# Altium project Thunderscope_Rev5.3.PrjPcb (part 3 of 3)

## Sheet CON_PCIe_X4.SchDoc
size 297 x 209 mm
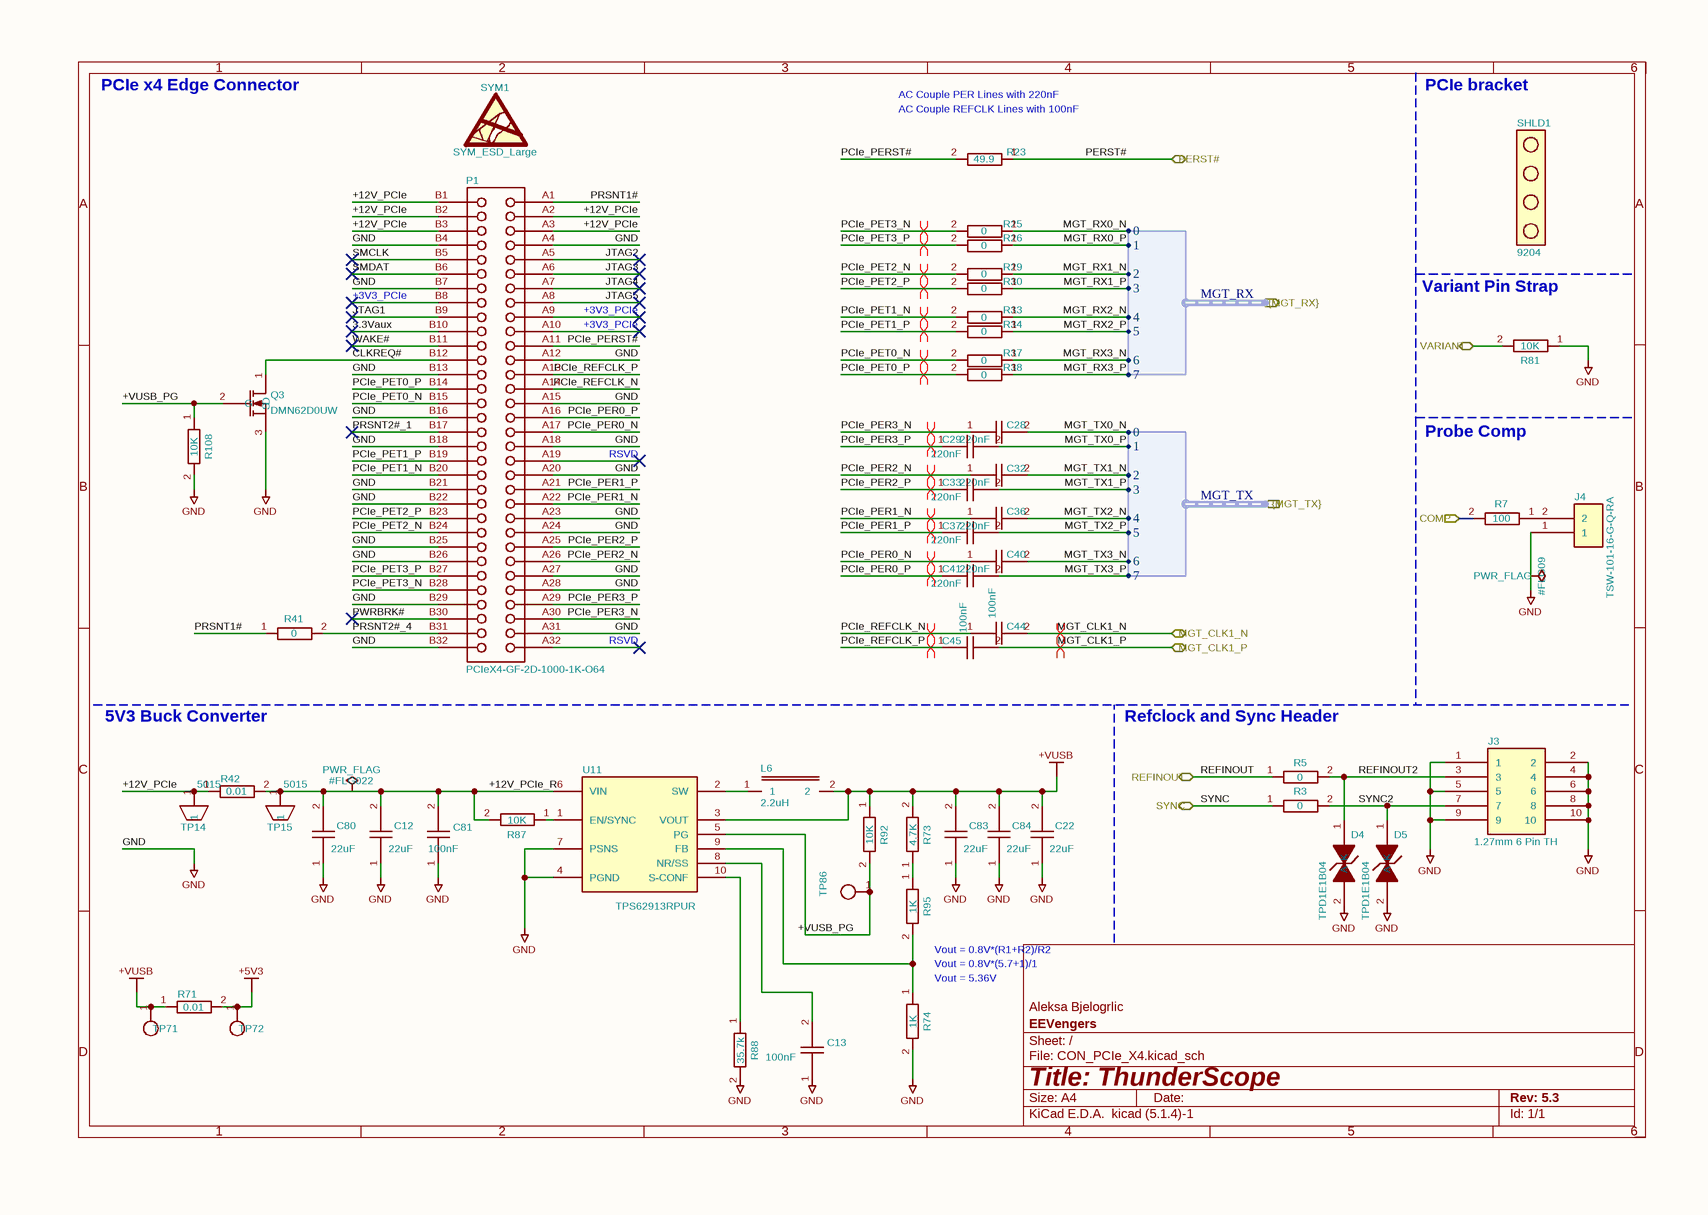
[diagram p11: CON_PCIe_X4.SchDoc]

### Parts
#FLG09  PWR_FLAG  (graphical)
#FLG022  PWR_FLAG  (graphical)
C12  22uF  [GEN_C_0805]
C13  100nF  [GEN_C_0402]
C22  22uF  [GEN_C_0805]
C28  220nF  [GEN_C_0402]
C29  220nF  [GEN_C_0402]
C32  220nF  [GEN_C_0402]
C33  220nF  [GEN_C_0402]
C36  220nF  [GEN_C_0402]
C37  220nF  [GEN_C_0402]
C40  220nF  [GEN_C_0402]
C41  220nF  [GEN_C_0402]
C44  100nF  [GEN_C_0402]
C45  100nF  [GEN_C_0402]
C80  22uF  [GEN_C_0805]
C81  100nF  [GEN_C_0402]
C83  22uF  [GEN_C_0805]
C84  22uF  [GEN_C_0805]
D4  TPD1E1B04  [TI_X1SON_DPY0002A]
D5  TPD1E1B04  [TI_X1SON_DPY0002A]
J3  1.27mm 6 Pin TH  [GEN_1.27mm_2x5_Pin_TH_RA]
J4  TSW-101-16-G-Q-RA  [GEN_5.08mm_1x2_Pin_TH_RA]
L6  2.2uH  [GEN_L_1210]
P1  PCIeX4-GF-2D-1000-1K-O64  [PCIeX4-GF-2D-1000-1K-O64]
Q3  DMN62D0UW  [GEN_SOT_323]
R3  0  [GEN_R_0402]
R5  0  [GEN_R_0402]
R7  100  [GEN_R_0402]
R23  49.9  [GEN_R_0402]
R25  0  [GEN_R_0402]
R26  0  [GEN_R_0402]
R29  0  [GEN_R_0402]
R30  0  [GEN_R_0402]
R33  0  [GEN_R_0402]
R34  0  [GEN_R_0402]
R37  0  [GEN_R_0402]
R38  0  [GEN_R_0402]
R41  0  [GEN_R_0402]
R42  0.01  [GEN_R_0603]
R71  0.01  [GEN_R_0603]
R73  4.7K  [GEN_R_0402]
R74  1K  [GEN_R_0402]
R81  10K  [GEN_R_0402]
R87  10K  [GEN_R_0402]
R88  35.7k  [GEN_R_0402]
R92  10K  [GEN_R_0402]
R95  1K  [GEN_R_0402]
R108  10K  [GEN_R_0402]
SHLD1  9204  (mechanical)
SYM1  SYM_ESD_Large  [ESD-Logo_6.6x6mm_SilkScreen]
TP14  5015  [KEY_5015]
TP15  5015  [KEY_5015]
TP71  PCB  [GEN_TP_PCB]  (value not drawn)
TP72  PCB  [GEN_TP_PCB]  (value not drawn)
TP86  PCB  [GEN_TP_PCB]  (value not drawn)
U11  value TPS62913RPUR  [TPS62913RPUR]  (hidden comment: TPS62913)

### Ports
COMP (in), MGT_CLK1_N (bidir), MGT_CLK1_P (bidir), PERST# (bidir), REFINOUT (bidir), SYNC (bidir), VARIANT (bidir), {MGT_RX} (out, harness MGT_RX), {MGT_TX} (in, harness MGT_TX)

### Harnesses
MGT_RX: 0, 1, 2, 3, 4, 5, 6, 7
MGT_TX: 0, 1, 2, 3, 4, 5, 6, 7

### Nets
+5V3: R71.2 TP72.1
+VUSB: C22.2 C83.2 C84.2 L6.2 R71.1 R73.2 R92.1 TP71.1 U11.3(VOUT)
GND: #FLG09.1 C12.1 C13.1 C22.1 C80.1 C81.1 C83.1 C84.1 D4.2(A) D5.2(A) J3.1 J3.2 J3.4 J3.5 J3.6 J3.8 J3.9 J3.10 J4.1 P1.A4 P1.A12 P1.A15 P1.A18 P1.A20 P1.A23 P1.A24 P1.A27 P1.A28 P1.A31 P1.B4 P1.B7 P1.B13 P1.B16 P1.B18 P1.B21 P1.B22 P1.B25 P1.B26 P1.B29 P1.B32 Q3.3(S) R74.2 R81.1 R88.2 R108.2 U11.4(PGND) U11.7(PSNS)
3.3Vaux: P1.B10
+12V_PCIe: P1.A2 P1.A3 P1.B1 P1.B2 P1.B3 R42.1 TP14.1
+12V_PCIe_R: #FLG022.1 C12.2 C80.2 C81.2 R42.2 R87.2 TP15.1 U11.6(VIN)
+VUSB_PG: Q3.2(G) R92.2 R108.1 TP86.1 U11.5(PG)
CLKREQ#: P1.B12 Q3.1(D)
COMP: R7.2 ; port COMP
JTAG1: P1.B9
JTAG2: P1.A5
JTAG3: P1.A6
JTAG4: P1.A7
JTAG5: P1.A8
MGT_CLK1_N: C44.2 ; port MGT_CLK1_N
MGT_CLK1_P: C45.2 ; port MGT_CLK1_P
MGT_RX0_N: R25.1 ; port {MGT_RX}.0
MGT_RX0_P: R26.1 ; port {MGT_RX}.1
MGT_RX1_N: R29.1 ; port {MGT_RX}.2
MGT_RX1_P: R30.1 ; port {MGT_RX}.3
MGT_RX2_N: R33.1 ; port {MGT_RX}.4
MGT_RX2_P: R34.1 ; port {MGT_RX}.5
MGT_RX3_N: R37.1 ; port {MGT_RX}.6
MGT_RX3_P: R38.1 ; port {MGT_RX}.7
MGT_TX0_N: C28.2 ; port {MGT_TX}.0
MGT_TX0_P: C29.2 ; port {MGT_TX}.1
MGT_TX1_N: C32.2 ; port {MGT_TX}.2
MGT_TX1_P: C33.2 ; port {MGT_TX}.3
MGT_TX2_N: C36.2 ; port {MGT_TX}.4
MGT_TX2_P: C37.2 ; port {MGT_TX}.5
MGT_TX3_N: C40.2 ; port {MGT_TX}.6
MGT_TX3_P: C41.2 ; port {MGT_TX}.7
PCIe_PER0_N: C40.1 P1.A17
PCIe_PER0_P: C41.1 P1.A16
PCIe_PER1_N: C36.1 P1.A22
PCIe_PER1_P: C37.1 P1.A21
PCIe_PER2_N: C32.1 P1.A26
PCIe_PER2_P: C33.1 P1.A25
PCIe_PER3_N: C28.1 P1.A30
PCIe_PER3_P: C29.1 P1.A29
PCIe_PERST#: P1.A11 R23.2
PCIe_PET0_N: P1.B15 R37.2
PCIe_PET0_P: P1.B14 R38.2
PCIe_PET1_N: P1.B20 R33.2
PCIe_PET1_P: P1.B19 R34.2
PCIe_PET2_N: P1.B24 R29.2
PCIe_PET2_P: P1.B23 R30.2
PCIe_PET3_N: P1.B28 R25.2
PCIe_PET3_P: P1.B27 R26.2
PCIe_REFCLK_N: C44.1 P1.A14
PCIe_REFCLK_P: C45.1 P1.A13
PERST#: R23.1 ; port PERST#
PRSNT1#: P1.A1 R41.1
PRSNT2#_1: P1.B17
PRSNT2#_4: P1.B31 R41.2
PWRBRK#: P1.B30
REFINOUT: R5.1 ; port REFINOUT
REFINOUT2: D4.1(K) J3.3 R5.2
SMCLK: P1.B5
SMDAT: P1.B6
SYNC: R3.1 ; port SYNC
SYNC2: D5.1(K) J3.7 R3.2
VARIANT: R81.2 ; port VARIANT
WAKE#: P1.B11
NetC13_2: C13.2 U11.8(NR/SS)
NetJ4_2: J4.2 R7.1
NetL6_1: L6.1 U11.2(SW)
NetR73_1: R73.1 R95.1
NetR74_1: R74.1 R95.2 U11.9(FB)
NetR87_1: R87.1 U11.1(EN/SYNC)
NetR88_1: R88.1 U11.10(S-CONF)

Not connected (* = marked no-connect by the designer): P1 A9* A10* A19* A32* B8*

### Layout directives
differential pair; differential pair class PCIe: PCIe_PER0_N, PCIe_PER0_P, PCIe_PER1_N, PCIe_PER1_P, PCIe_PER2_N, PCIe_PER2_P, PCIe_PER3_N, PCIe_PER3_P, PCIe_PET0_N, PCIe_PET0_P, PCIe_PET1_N, PCIe_PET1_P, PCIe_PET2_N, PCIe_PET2_P, PCIe_PET3_N, PCIe_PET3_P, PCIe_REFCLK_N, PCIe_REFCLK_P
differential pair: MGT_CLK1_N, MGT_CLK1_P

### Notes on the sheet
- PCIe x4 Edge Connector
- AC Couple PER Lines with 220nF
- (near R23) AC Couple REFCLK Lines with 100nF
- PCIe bracket
- +3V3_PCIe
- (near R81) Variant Pin Strap
- RSVD
- Probe Comp
- 5V3 Buck Converter
- Refclock and Sync Header
- Vout = 0.8V*(5.7+1)/1
- (near R95) Vout = 0.8V*(R1+R2)/R2
- (near R74) Vout = 5.36V
- 1
- 2
- 3
- 4
- 5
- 6
- A
- B
- C
- Aleksa Bjelogrlic
- D
- Title: ThunderScope
- File: CON_PCIe_X4.kicad_sch
- Sheet: /
- EEVengers
- KiCad E.D.A.  kicad (5.1.4)-1
- Size: A4
- Date:
- Rev: 5.3
- Id: 1/1

### Library data of the parts
C12 C22 C80 C83 C84 = CAP 22uF 25V X5R 0805: HOUSE PART NUMBER: C-22uF-0805-002; MANUFACTURER: Murata; MANUFACTURER PART NUMBER: GRM21BR61E226ME44L; VOLTAGE RATING: 25V; Substitutions Policy: Any Parametric Equivalent; PACKAGE: 0805; SUPPLIER 1: Mouser; SUPPLIER PART NUMBER 1: 81-GRM21BR61E226ME4L; Footprint: Thunderscope_Rev5:GEN_C_0805; Value: 22uF
C13 C44 C45 C81 = CAP 100nF 16V X7R 0402: HOUSE PART NUMBER: C-100nF-0402-002; MANUFACTURER: Murata; MANUFACTURER PART NUMBER: GCM155R71C104KA55D; VOLTAGE RATING: 16V; Substitutions Policy: Any Parametric Equivalent; PACKAGE: 0402; SUPPLIER 1: Mouser; SUPPLIER PART NUMBER 1: 81-GCM155R71C104KA5D; Footprint: Thunderscope_Rev5:GEN_C_0402; Value: 100nF
C28 C29 C32 C33 C36 C37 C40 C41 = CAP 220nF 16V X7R 0402: HOUSE PART NUMBER: C-100nF-0402-002; MANUFACTURER: Murata; MANUFACTURER PART NUMBER: GCM155R71C224KE02D; VOLTAGE RATING: 16V; Substitutions Policy: Any Parametric Equivalent; PACKAGE: 0402; SUPPLIER 1: Mouser; SUPPLIER PART NUMBER 1: 81-GCM155R71C224KE2D; Footprint: Thunderscope_Rev5:GEN_C_0402; Value: 220nF
D4 D5 = TVS TPD1E1B04: MANUFACTURER: Texas Instruments; MANUFACTURER PART NUMBER: TPD1E1B04DPYR; Substitutions Policy: No Substitutions; SUPPLIER 1: Texas Instruments; SUPPLIER PART NUMBER 1: TPD1E1B04DPYR; PACKAGE: 2-X1SON (1x0.6mm); Footprint: Thunderscope_Rev5:TI_X1SON_DPY0002A; Value: TPD1E1B04
J3 = CONN 1.27mm 2x5 Pin TH RA: MANUFACTURER: CNC Tech; MANUFACTURER PART NUMBER: 3220-10-0200-00; Substitutions Policy: ECO Required for Substitution; SUPPLIER 1: Digi-Key; SUPPLIER PART NUMBER 1: 1175-1628-ND; PACKAGE: Through Hole; Footprint: Thunderscope_Rev5:GEN_1.27mm_2x5_Pin_TH_RA; Value: 1.27mm 6 Pin TH
J4 = CONN 5.08mm 2 Pin TH RA: MANUFACTURER: Samtec; Substitutions Policy: ECO Required for Substitution; SUPPLIER 1: Mouser; SUPPLIER PART NUMBER 1: 200-TSW10116GQRA; MANUFACTURER PART NUMBER: TSW-101-16-G-Q-RA; PACKAGE: Through Hole; Value: TSW-101-16-G-Q-RA; Footprint: Thunderscope_Rev5:GEN_5.08mm_1x2_Pin_TH_RA
L6 = IND 1uH 5.5A 32 MOHM 1210: DFE322520FD-2R2M=P2; HOUSE PART NUMBER: SRP3212-1R0M; MANUFACTURER: Bourns; Substitutions Policy: ECO Required for Substitution; SUPPLIER 1: Mouser; SUPPLIER PART NUMBER 1: 652-SRP3212-1R0M; MANUFACTURER PART NUMBER: SRP3212-1R0M; PACKAGE: 1210; Value: 2.2uH; Footprint: Thunderscope_Rev5:GEN_L_1210
P1 = PCIeX4-GF-2D-1000-1K-O64: MATING CONNECTOR: Molex-87715-9106; DATASHEET VERSION: rev2.0, Apr-2007; PACKAGE REFERENCE: PCIeX4-GF-2D-1000-1K-O64; CLASSNAME: Edge Connector; PUBLISHER: Altium; COMPONENT KIND: Standard (No BOM); Footprint: Thunderscope_Rev5:PCIeX4-GF-2D-1000-1K-O64; Value: PCIeX4-GF-2D-1000-1K-O64
Q3 = NMOS DMN62D0UW: HOUSE PART NUMBER: DMN62D0UW-7; MANUFACTURER: Diodes; VDSS: 60V; Substitutions Policy: ECO Required for Substitution; SUPPLIER 1: Mouser; SUPPLIER PART NUMBER 1: 621-DMN62D0UW-7; MANUFACTURER PART NUMBER: DMN62D0UW-7; PACKAGE: SOT-323; Value: DMN62D0UW; Footprint: Thunderscope_Rev5:GEN_SOT_323
R3 R5 R25 R26 R29 R30 R33 R34 R37 R38 R41 = RES 0 OHM 1/16W 0402: MANUFACTURER: Yageo; MANUFACTURER PART NUMBER: RC0402JR-070RL; Substitutions Policy: Any Parametric Equivalent; PACKAGE: 0402; SUPPLIER 1: Mouser; SUPPLIER PART NUMBER 1: 603-RC0402JR-070RL; Footprint: Thunderscope_Rev5:GEN_R_0402; Value: 0
R7 = RES 100 OHM 1% 1/10W 0402: MANUFACTURER: Yageo; MANUFACTURER PART NUMBER: RC0402FR-07100RL; TOLERANCE: 1%; Substitutions Policy: Any Parametric Equivalent; PACKAGE: 0402; SUPPLIER 1: Mouser; SUPPLIER PART NUMBER 1: 603-RC0402FR-07100RL; Footprint: Thunderscope_Rev5:GEN_R_0402; Value: 100
R23 = RES 49.9 OHM 1% 1/10W 0402: MANUFACTURER: Yageo; MANUFACTURER PART NUMBER: RC0402FR-0749R9L; TOLERANCE: 1%; Substitutions Policy: Any Parametric Equivalent; PACKAGE: 0402; SUPPLIER 1: Mouser; SUPPLIER PART NUMBER 1: 603-RC0402FR-0749R9L; Footprint: Thunderscope_Rev5:GEN_R_0402; Value: 49.9
R42 R71 = RES 0.01 OHM 1% 1/4W 0603: HOUSE PART NUMBER: R-0.01-0603-1%-001; MANUFACTURER: Susumu; MANUFACTURER PART NUMBER: RL0816T-R010-F; TOLERANCE: 1%; Substitutions Policy: Any Parametric Equivalent; SUPPLIER 1: Mouser; SUPPLIER PART NUMBER 1: 754-RL0816T-R010-F; PACKAGE: 0603; Footprint: Thunderscope_Rev5:GEN_R_0603; Value: 0.01
R73 = RES 4.7K OHM 1% 1/16W 0402: MANUFACTURER: Yageo; MANUFACTURER PART NUMBER: RC0402FR-074K7L; TOLERANCE: 1%; Substitutions Policy: Any Parametric Equivalent; PACKAGE: 0402; SUPPLIER 1: Mouser; SUPPLIER PART NUMBER 1: 603-RC0402FR-074K7L; Footprint: Thunderscope_Rev5:GEN_R_0402; Value: 4.7K
R74 R95 = RES 1K OHM 1% 1/10W 0402: HOUSE PART NUMBER: R-1K-0402-1%-001; MANUFACTURER: Yageo; MANUFACTURER PART NUMBER: RC0402FR-071KL; TOLERANCE: 1%; Substitutions Policy: Any Parametric Equivalent; PACKAGE: 0402; SUPPLIER 1: Mouser; SUPPLIER PART NUMBER 1: 603-RC0402FR-071KL; Footprint: Thunderscope_Rev5:GEN_R_0402; Value: 1K
R81 R87 R92 R108 = RES 10K OHM 1% 1/16W 0402: MANUFACTURER: Yageo; MANUFACTURER PART NUMBER: RC0402FR-0710KL; TOLERANCE: 1%; Substitutions Policy: Any Parametric Equivalent; PACKAGE: 0402; SUPPLIER 1: Mouser; SUPPLIER PART NUMBER 1: 603-RC0402FR-0710KL; Footprint: Thunderscope_Rev5:GEN_R_0402; Value: 10K
R88 = RES 35.7K OHM 1% 1/16W 0402: MANUFACTURER: Yageo; MANUFACTURER PART NUMBER: RC0402FR-0735K7L; TOLERANCE: 1%; Substitutions Policy: Any Parametric Equivalent; PACKAGE: 0402; SUPPLIER 1: Mouser; SUPPLIER PART NUMBER 1: 603-RC0402FR-0735K7L; Footprint: Thunderscope_Rev5:GEN_R_0402; Value: 35.7k
SHLD1 = PCIe IO Shield: MANUFACTURER: Keystone Electronics; SUPPLIER 1: Mouser; SUPPLIER PART NUMBER 1: 534-9204; MANUFACTURER PART NUMBER: 9204; Value: 9204
TP14 TP15 = TP KEYSTONE 5015: MANUFACTURER: Keystone Electronics; SUPPLIER 1: Mouser; SUPPLIER PART NUMBER 1: 534-5015; MANUFACTURER PART NUMBER: 5015; Footprint: Thunderscope_Rev5:KEY_5015; Value: 5015
TP71 TP72 TP86 = TP PCB 1mm: Footprint: Thunderscope_Rev5:GEN_TP_PCB; Value: PCB
U11 = IC BUCK MODULE TPS62913: MANUFACTURER: Texas Instruments; MANUFACTURER PART NUMBER: TPSM82913RDUR; Substitutions Policy: No Substitutions; SUPPLIER 1: Texas Instruments; SUPPLIER PART NUMBER 1: TPSM82913RDUR; PACKAGE: 28-B0QFN (4.5x5.5mm); Footprint: Thunderscope_Rev5:TI_B0QFN_RDU0028A
#FLG09 #FLG022 = PWR_FLAG: Value: PWR_FLAG
SYM1 = SYM_ESD_Large: Value: SYM_ESD_Large; Footprint: Symbol:ESD-Logo_6.6x6mm_SilkScreen

## Sheet ADC.SchDoc
size 297 x 209 mm
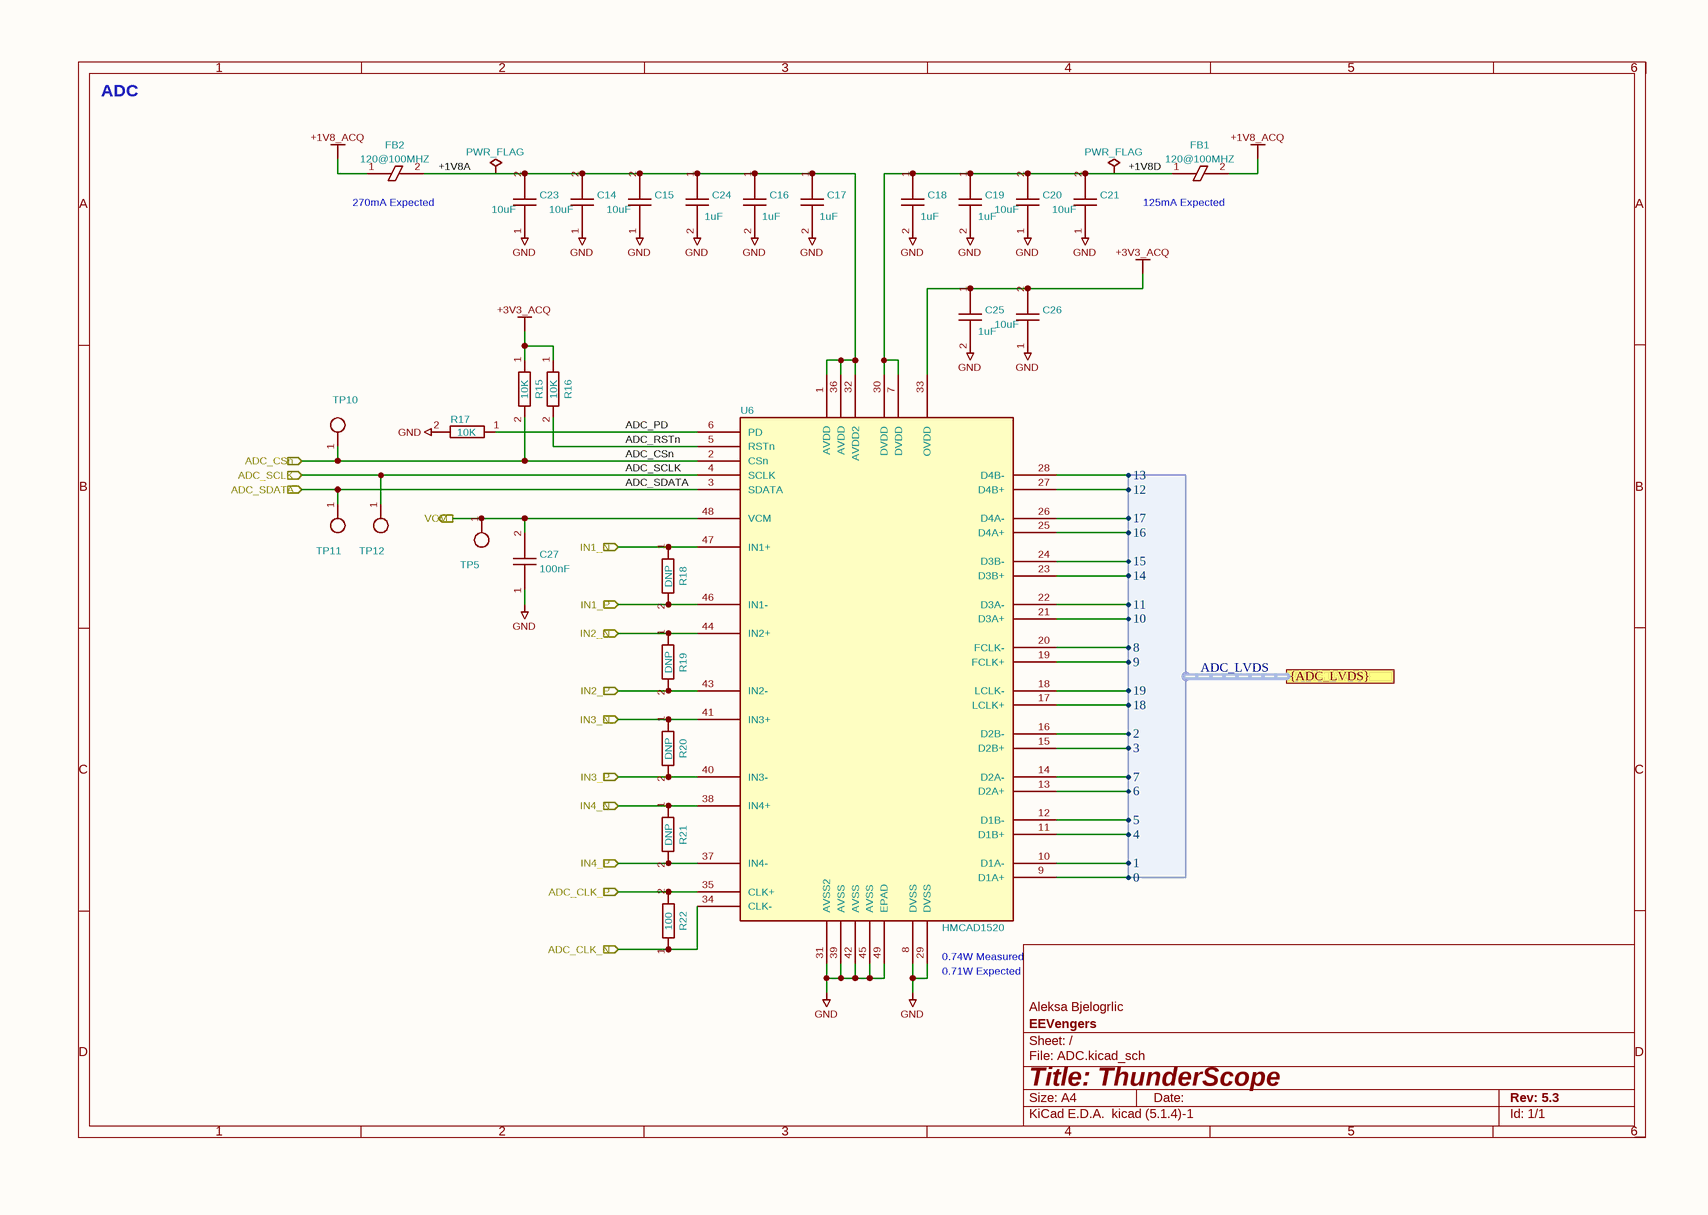
[diagram p12: ADC.SchDoc]

### Parts
#FLG07  PWR_FLAG  (graphical)
#FLG08  PWR_FLAG  (graphical)
C14  10uF  [GEN_C_0603]
C15  10uF  [GEN_C_0603]
C16  1uF  [GEN_C_0402]
C17  1uF  [GEN_C_0402]
C18  1uF  [GEN_C_0402]
C19  1uF  [GEN_C_0402]
C20  10uF  [GEN_C_0603]
C21  10uF  [GEN_C_0603]
C23  10uF  [GEN_C_0603]
C24  1uF  [GEN_C_0402]
C25  1uF  [GEN_C_0402]
C26  10uF  [GEN_C_0603]
C27  100nF  [GEN_C_0402]
FB1  120@100MHZ  [GEN_R_0402]
FB2  120@100MHZ  [GEN_R_0402]
R15  10K  [GEN_R_0402]
R16  10K  [GEN_R_0402]
R17  10K  [GEN_R_0402]
R18  DNP  [GEN_R_0402]
R19  DNP  [GEN_R_0402]
R20  DNP  [GEN_R_0402]
R21  DNP  [GEN_R_0402]
R22  100  [GEN_R_0402]
TP5  PCB  [GEN_TP_PCB]  (value not drawn)
TP10  PCB  [GEN_TP_PCB]  (value not drawn)
TP11  PCB  [GEN_TP_PCB]  (value not drawn)
TP12  PCB  [GEN_TP_PCB]  (value not drawn)
U6  HMCAD1520  [AD_QFN48_LP7]

### Ports
ADC_CLK_N (in), ADC_CLK_P (in), ADC_CSn (in), ADC_SCLK (in), ADC_SDATA (in), IN1_N (in), IN1_P (in), IN2_N (in), IN2_P (in), IN3_N (in), IN3_P (in), IN4_N (in), IN4_P (in), VCM (out), {ADC_LVDS} (harness ADC_LVDS)

### Harnesses
ADC_LVDS: 0, 1, 2, 3, 4, 5, 6, 7, 8, 9, 10, 11, 12, 13, 14, 15, 16, 17, 18, 19

### Nets
+1V8_ACQ: FB1.2 FB2.1
+3V3_ACQ: C25.1 C26.2 R15.1 R16.1 U6.33(OVDD)
GND: C14.1 C15.1 C16.2 C17.2 C18.2 C19.2 C20.1 C21.1 C23.1 C24.2 C25.2 C26.1 C27.1 R17.2 U6.8(DVSS) U6.29(DVSS) U6.31(AVSS2) U6.39(AVSS) U6.42(AVSS) U6.45(AVSS) U6.49(EPAD)
+1V8A: #FLG07.1 C14.2 C15.2 C16.1 C17.1 C23.2 C24.1 FB2.2 U6.1(AVDD) U6.32(AVDD2) U6.36(AVDD)
+1V8D: #FLG08.1 C18.1 C19.1 C20.2 C21.2 FB1.1 U6.7(DVDD) U6.30(DVDD)
ADC_CLK_N: R22.1 U6.34(CLK-) ; port ADC_CLK_N
ADC_CLK_P: R22.2 U6.35(CLK+) ; port ADC_CLK_P
ADC_CSn: R15.2 TP10.1 U6.2(CSn) ; port ADC_CSn
ADC_PD: R17.1 U6.6(PD)
ADC_RSTn: R16.2 U6.5(RSTn)
ADC_SCLK: TP12.1 U6.4(SCLK) ; port ADC_SCLK
ADC_SDATA: TP11.1 U6.3(SDATA) ; port ADC_SDATA
D1A_N: U6.10(D1A-) ; port {ADC_LVDS}.1
D1A_P: U6.9(D1A+) ; port {ADC_LVDS}.0
D1B_N: U6.12(D1B-) ; port {ADC_LVDS}.5
D1B_P: U6.11(D1B+) ; port {ADC_LVDS}.4
D2A_N: U6.14(D2A-) ; port {ADC_LVDS}.7
D2A_P: U6.13(D2A+) ; port {ADC_LVDS}.6
D2B_N: U6.16(D2B-) ; port {ADC_LVDS}.2
D2B_P: U6.15(D2B+) ; port {ADC_LVDS}.3
D3A_N: U6.22(D3A-) ; port {ADC_LVDS}.11
D3A_P: U6.21(D3A+) ; port {ADC_LVDS}.10
D3B_N: U6.24(D3B-) ; port {ADC_LVDS}.15
D3B_P: U6.23(D3B+) ; port {ADC_LVDS}.14
D4A_N: U6.26(D4A-) ; port {ADC_LVDS}.17
D4A_P: U6.25(D4A+) ; port {ADC_LVDS}.16
D4B_N: U6.28(D4B-) ; port {ADC_LVDS}.13
D4B_P: U6.27(D4B+) ; port {ADC_LVDS}.12
FCLK_N: U6.20(FCLK-) ; port {ADC_LVDS}.8
FCLK_P: U6.19(FCLK+) ; port {ADC_LVDS}.9
IN1_N: R18.1 U6.47(IN1+) ; port IN1_N
IN1_P: R18.2 U6.46(IN1-) ; port IN1_P
IN2_N: R19.1 U6.44(IN2+) ; port IN2_N
IN2_P: R19.2 U6.43(IN2-) ; port IN2_P
IN3_N: R20.1 U6.41(IN3+) ; port IN3_N
IN3_P: R20.2 U6.40(IN3-) ; port IN3_P
IN4_N: R21.1 U6.38(IN4+) ; port IN4_N
IN4_P: R21.2 U6.37(IN4-) ; port IN4_P
LCLK_N: U6.18(LCLK-) ; port {ADC_LVDS}.19
LCLK_P: U6.17(LCLK+) ; port {ADC_LVDS}.18
VCM: C27.2 TP5.1 U6.48(VCM) ; port VCM

### Notes on the sheet
- ADC
- (near FB2) 270mA Expected
- 125mA Expected
- (near U6) 0.74W Measured
- (near U6) 0.71W Expected
- 1
- 2
- 3
- 4
- 5
- 6
- A
- B
- C
- Aleksa Bjelogrlic
- D
- Title: ThunderScope
- File: ADC.kicad_sch
- Sheet: /
- EEVengers
- KiCad E.D.A.  kicad (5.1.4)-1
- Size: A4
- Date:
- Rev: 5.3
- Id: 1/1

### Library data of the parts
C14 C15 C20 C21 C23 C26 = CAP 10uF 25V X5R 0603: MANUFACTURER: Murata; MANUFACTURER PART NUMBER: GRM188R61E106MA73D; VOLTAGE RATING: 25V; Substitutions Policy: Any Parametric Equivalent; PACKAGE: 0402; SUPPLIER 1: Mouser; SUPPLIER PART NUMBER 1: 81-GRM188R61E106MA3D; Footprint: Thunderscope_Rev5:GEN_C_0603; Value: 10uF
C16-C19 C24 C25 = CAP 1uF 25V X5R 0402: MANUFACTURER: Murata; MANUFACTURER PART NUMBER: GRM155R61E105KA12D; VOLTAGE RATING: 25V; Substitutions Policy: Any Parametric Equivalent; PACKAGE: 0402; SUPPLIER 1: Mouser; SUPPLIER PART NUMBER 1: 81-GRM155R61E105KA2D; Footprint: Thunderscope_Rev5:GEN_C_0402; Value: 1uF
C27 = CAP 100nF 16V X7R 0402: as C13 on sheet CON_PCIe_X4; PACKAGE: 0402; SUPPLIER 1: Mouser; SUPPLIER PART NUMBER 1: 81-GCM155R71C104KA5D; Footprint: Thunderscope_Rev5:GEN_C_0402; Value: 100nF
FB1 FB2 = FERRITE BEAD 120 OHM 0402: HOUSE PART NUMBER: BLM15PX121SN1D; MANUFACTURER: Murata; Substitutions Policy: No Substitutions; SUPPLIER 1: Mouser; SUPPLIER PART NUMBER 1: 81-BLM15PX121SN1D; MANUFACTURER PART NUMBER: BLM15PX121SN1D; PACKAGE: 0402; Footprint: Thunderscope_Rev5:GEN_R_0402; Value: 120@100MHZ
R15-R17 = RES 10K OHM 1% 1/16W 0402: as R81 on sheet CON_PCIe_X4; PACKAGE: 0402; SUPPLIER 1: Mouser; SUPPLIER PART NUMBER 1: 603-RC0402FR-0710KL; Footprint: Thunderscope_Rev5:GEN_R_0402; Value: 10K
R18-R21 = RES DNP 0402: TOLERANCE: 1%; PACKAGE: 0402; Footprint: Thunderscope_Rev5:GEN_R_0402; Value: DNP
R22 = RES 100 OHM 1% 1/10W 0402: as R7 on sheet CON_PCIe_X4; PACKAGE: 0402; SUPPLIER 1: Mouser; SUPPLIER PART NUMBER 1: 603-RC0402FR-07100RL; Footprint: Thunderscope_Rev5:GEN_R_0402; Value: 100
TP5 TP10-TP12 = TP PCB 1mm: Footprint: Thunderscope_Rev5:GEN_TP_PCB; Value: PCB
U6 = IC ADC HMCAD1520: MANUFACTURER: Analog Devices; Substitutions Policy: No Substitutions; SUPPLIER 1: Mouser; SUPPLIER PART NUMBER 1: 584-HMCAD1520; MANUFACTURER PART NUMBER: HMCAD1520; PACKAGE: 48-QFN (7x7mm); Footprint: Thunderscope_Rev5:AD_QFN48_LP7; Value: HMCAD1520
#FLG07 #FLG08 = PWR_FLAG: Value: PWR_FLAG

## Sheet FE.SchDoc
size 297 x 209 mm
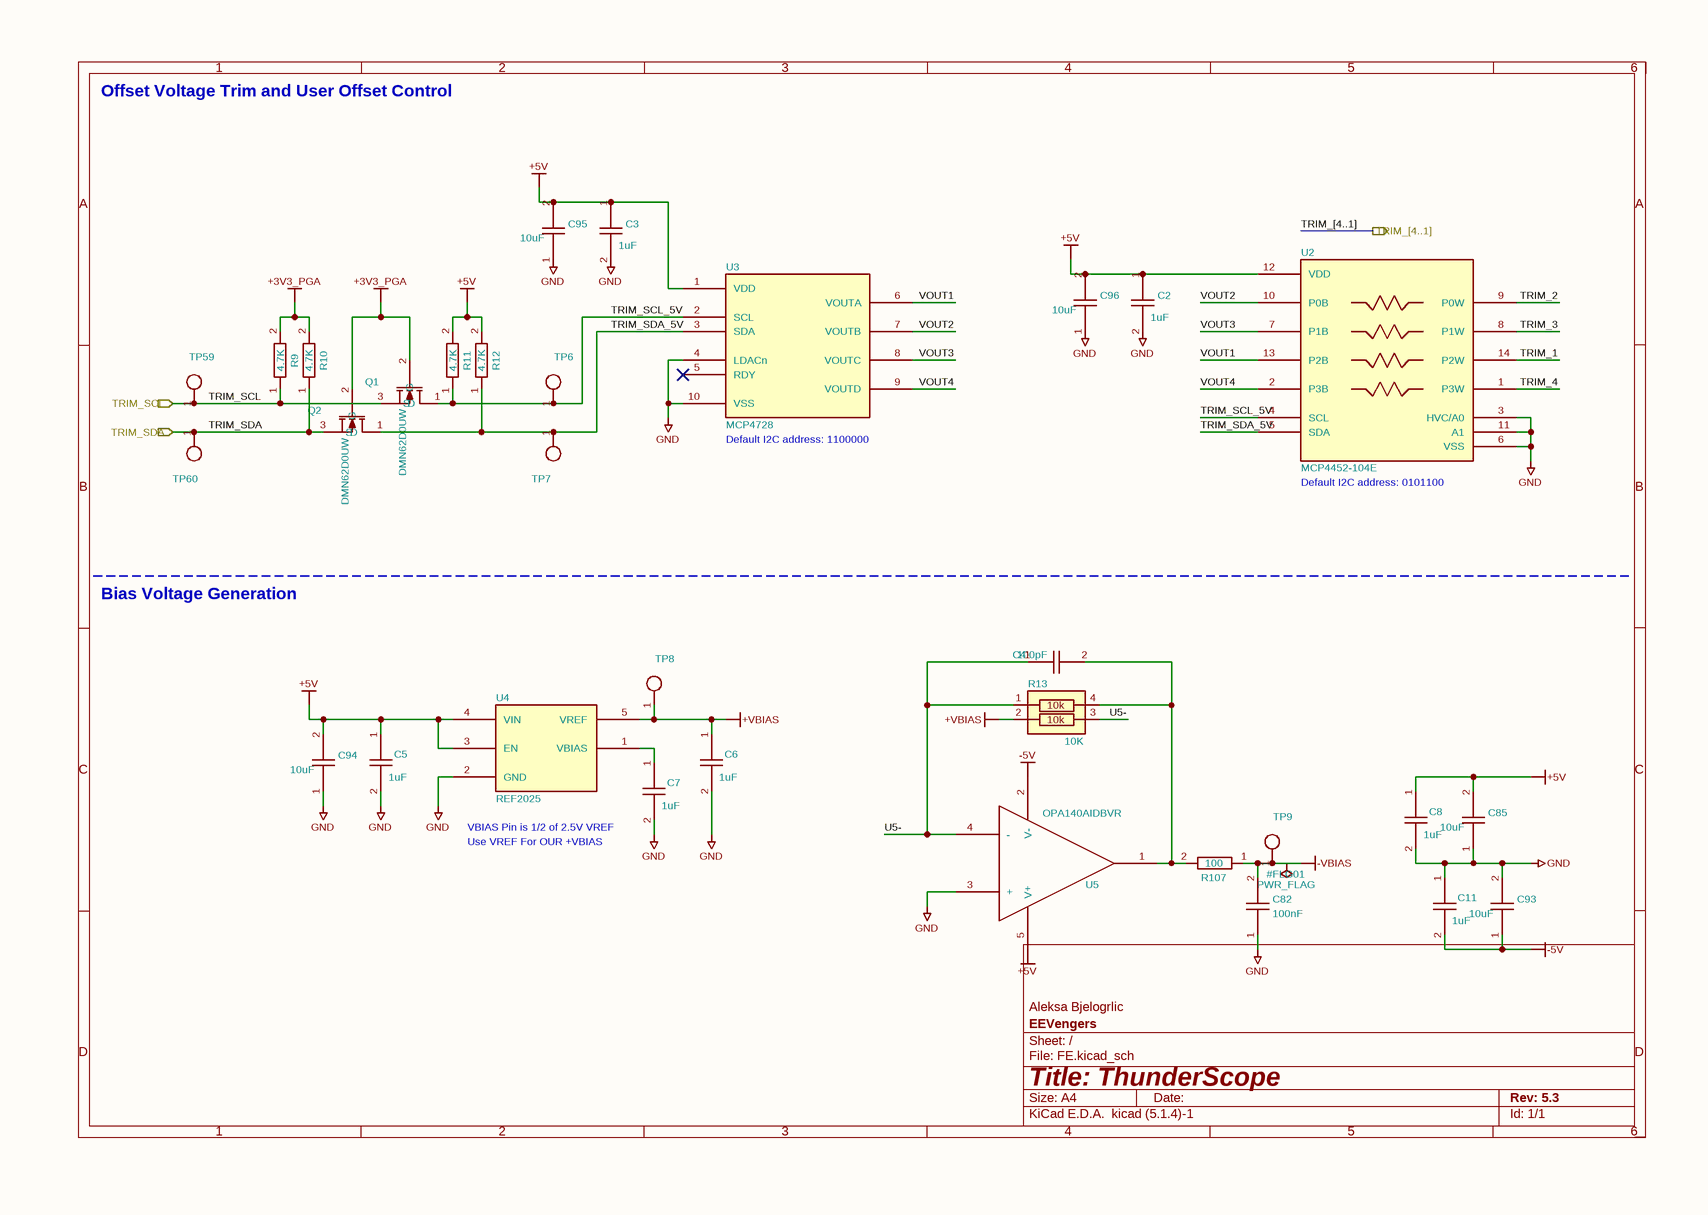
[diagram p13: FE.SchDoc]

### Parts
#FLG01  PWR_FLAG  (graphical)
C2  1uF  [GEN_C_0402]
C3  1uF  [GEN_C_0402]
C4  100pF  [GEN_C_0402]
C5  1uF  [GEN_C_0402]
C6  1uF  [GEN_C_0402]
C7  1uF  [GEN_C_0402]
C8  1uF  [GEN_C_0402]
C11  1uF  [GEN_C_0402]
C82  100nF  [GEN_C_0402]
C85  10uF  [GEN_C_0603]
C93  10uF  [GEN_C_0603]
C94  10uF  [GEN_C_0603]
C95  10uF  [GEN_C_0603]
C96  10uF  [GEN_C_0603]
Q1  DMN62D0UW  [GEN_SOT_323]
Q2  DMN62D0UW  [GEN_SOT_323]
R9  4.7K  [GEN_R_0402]
R10  4.7K  [GEN_R_0402]
R11  4.7K  [GEN_R_0402]
R12  4.7K  [GEN_R_0402]
R13  10K  [GEN_R_2ARRAY_0606]
R107  100  [GEN_R_0402]
TP6  PCB  [GEN_TP_PCB]  (value not drawn)
TP7  PCB  [GEN_TP_PCB]  (value not drawn)
TP8  PCB  [GEN_TP_PCB]  (value not drawn)
TP9  PCB  [GEN_TP_PCB]  (value not drawn)
TP59  PCB  [GEN_TP_PCB]  (value not drawn)
TP60  PCB  [GEN_TP_PCB]  (value not drawn)
U2  MCP4452-104E  [MC_TSSOP14]
U3  MCP4728  [MC_MSOP10_UN]
U4  REF2025  [GEN_SOT23_5_950_2900X1600X1450]
U5  OPA140AIDBVR  [GEN_SOT23_5_950_2900X1600X1450]

### Ports
TRIM_[4..1] (out), TRIM_SCL (in), TRIM_SDA (in)

### Nets
+3V3_PGA: Q1.2(G) Q2.2(G) R9.2 R10.2
+5V: C2.1 C3.1 C5.1 C8.1 C85.2 C94.2 C95.2 C96.2 R11.2 R12.2 U2.12(VDD) U3.1(VDD) U4.3(EN) U4.4(VIN) U5.5(V+)
+VBIAS: C6.1 R13.2 TP8.1 U4.5(VREF)
-5V: C11.2 C93.1 U5.2(V-)
-VBIAS: #FLG01.1 C82.2 R107.1 TP9.1
GND: C2.2 C3.2 C5.2 C6.2 C7.2 C8.2 C11.1 C82.1 C85.1 C93.2 C94.1 C95.1 C96.1 U2.3(HVC/A0) U2.6(VSS) U2.11(A1) U3.4(LDACn) U3.10(VSS) U4.2(GND) U5.3(+)
TRIM_1: U2.14(P2W)
TRIM_2: U2.9(P0W)
TRIM_3: U2.8(P1W)
TRIM_4: U2.1(P3W)
TRIM_SCL: Q1.3(S) R9.1 TP59.1 ; port TRIM_SCL
TRIM_SCL_5V: Q1.1(D) R11.1 TP6.1 U2.4(SCL) U3.2(SCL)
TRIM_SDA: Q2.3(S) R10.1 TP60.1 ; port TRIM_SDA
TRIM_SDA_5V: Q2.1(D) R12.1 TP7.1 U2.5(SDA) U3.3(SDA)
U5-: C4.1 R13.1 R13.3 U5.4(-)
VOUT1: U2.13(P2B) U3.6(VOUTA)
VOUT2: U2.10(P0B) U3.7(VOUTB)
VOUT3: U2.7(P1B) U3.8(VOUTC)
VOUT4: U2.2(P3B) U3.9(VOUTD)
NetC4_2: C4.2 R13.4 R107.2 U5.1(OUT)
NetC7_1: C7.1 U4.1(VBIAS)

Not connected (* = marked no-connect by the designer): U3 5(RDY)*

### Buses and harness runs
bus TRIM_[4..1] = port TRIM_[4..1]

### Notes on the sheet
- Offset Voltage Trim and User Offset Control
- (near U3) Default I2C address: 1100000
- (near U2) Default I2C address: 0101100
- Bias Voltage Generation
- Use VREF For OUR +VBIAS
- VBIAS Pin is 1/2 of 2.5V VREF
- 1
- 2
- 3
- 4
- 5
- 6
- A
- B
- C
- Aleksa Bjelogrlic
- D
- Title: ThunderScope
- File: FE.kicad_sch
- Sheet: /
- EEVengers
- KiCad E.D.A.  kicad (5.1.4)-1
- Size: A4
- Date:
- Rev: 5.3
- Id: 1/1
- (in symbol RES ARRAY 2x 10K OHM 0.05% 0606) 10k

### Library data of the parts
C2 C3 C5-C8 C11 = CAP 1uF 25V X5R 0402: as C16 on sheet ADC; PACKAGE: 0402; SUPPLIER 1: Mouser; SUPPLIER PART NUMBER 1: 81-GRM155R61E105KA2D; Footprint: Thunderscope_Rev5:GEN_C_0402; Value: 1uF
C4 = CAP 100pF 50V C0G 0402: MANUFACTURER: Murata; MANUFACTURER PART NUMBER: GCM1555C1H101FA16D; TEMPERATURE COEFFICIENT: C0G; VOLTAGE RATING: 50V; Substitutions Policy: Any Parametric Equivalent; PACKAGE: 0402; SUPPLIER 1: Mouser; SUPPLIER PART NUMBER 1: 81-GCM1555C1H101FA6D; Footprint: Thunderscope_Rev5:GEN_C_0402; Value: 100pF
C82 = CAP 100nF 16V X7R 0402: as C13 on sheet CON_PCIe_X4; PACKAGE: 0402; SUPPLIER 1: Mouser; SUPPLIER PART NUMBER 1: 81-GCM155R71C104KA5D; Footprint: Thunderscope_Rev5:GEN_C_0402; Value: 100nF
C85 C93-C96 = CAP 10uF 25V X5R 0603: as C14 on sheet ADC; PACKAGE: 0402; SUPPLIER 1: Mouser; SUPPLIER PART NUMBER 1: 81-GRM188R61E106MA3D; Footprint: Thunderscope_Rev5:GEN_C_0603; Value: 10uF
Q1 Q2 = NMOS DMN62D0UW: as Q3 on sheet CON_PCIe_X4; SUPPLIER 1: Mouser; SUPPLIER PART NUMBER 1: 621-DMN62D0UW-7; MANUFACTURER PART NUMBER: DMN62D0UW-7; PACKAGE: SOT-323; Value: DMN62D0UW; Footprint: Thunderscope_Rev5:GEN_SOT_323
R9-R12 = RES 4.7K OHM 1% 1/16W 0402: as R73 on sheet CON_PCIe_X4; PACKAGE: 0402; SUPPLIER 1: Mouser; SUPPLIER PART NUMBER 1: 603-RC0402FR-074K7L; Footprint: Thunderscope_Rev5:GEN_R_0402; Value: 4.7K
R13 = RES ARRAY 2x 10K OHM 0.05% 0606: MANUFACTURER: Vishay Beyschlag; MANUFACTURER PART NUMBER: ACASN1002S1002P1ATF1002X; TOLERANCE: 1%; Substitutions Policy: No Substitutions; PACKAGE: 0606; SUPPLIER 1: Mouser; SUPPLIER PART NUMBER 1: 594-ACASN1002S1002AT; Footprint: Thunderscope_Rev5:GEN_R_2ARRAY_0606; Value: 10K
R107 = RES 100 OHM 1% 1/10W 0402: as R7 on sheet CON_PCIe_X4; PACKAGE: 0402; SUPPLIER 1: Mouser; SUPPLIER PART NUMBER 1: 603-RC0402FR-07100RL; Footprint: Thunderscope_Rev5:GEN_R_0402; Value: 100
TP6-TP9 TP59 TP60 = TP PCB 1mm: Footprint: Thunderscope_Rev5:GEN_TP_PCB; Value: PCB
U2 = IC DIGIPOT QUAD MCP4452-104E: MANUFACTURER: Microchip; Substitutions Policy: ECO Required for Substitution; SUPPLIER 1: Mouser; SUPPLIER PART NUMBER 1: 579-MCP4452-104E/ST; MANUFACTURER PART NUMBER: MCP4452-104E; PACKAGE: 14-TSSOP; Value: MCP4452-104E; Footprint: Thunderscope_Rev5:MC_TSSOP14
U3 = IC DAC QUAD MCP4728: MANUFACTURER: Microchip; MANUFACTURER PART NUMBER: MCP4728T-E/UN; Substitutions Policy: ECO Required for Substitution; SUPPLIER 1: Mouser; SUPPLIER PART NUMBER 1: 579-MCP4728T-E/UN; PACKAGE: 10-MSOP; Value: MCP4728; Footprint: Thunderscope_Rev5:MC_MSOP10_UN
U4 = IC VREF REF2025: MANUFACTURER: Texas Instruments; MANUFACTURER PART NUMBER: REF2025AIDDCR; Substitutions Policy: No Substitutions; SUPPLIER 1: Texas Instruments; SUPPLIER PART NUMBER 1: REF2025AIDDCR; PACKAGE: SOT-23-5; Value: REF2025; Footprint: Thunderscope_Rev5:GEN_SOT23_5_950_2900X1600X1450
U5 = IC OPAMP OPA140: MANUFACTURER: Texas Instruments; Substitutions Policy: No Substitutions; SUPPLIER 1: Texas Instruments; SUPPLIER PART NUMBER 1: OPA140AIDBVR; MANUFACTURER PART NUMBER: OPA140AIDBVR; PACKAGE: SOT-23-5; Value: OPA140AIDBVR; Footprint: Thunderscope_Rev5:GEN_SOT23_5_950_2900X1600X1450
#FLG01 = PWR_FLAG: Value: PWR_FLAG

## Sheet ACQ_FE_VREG.SchDoc
size 297 x 209 mm
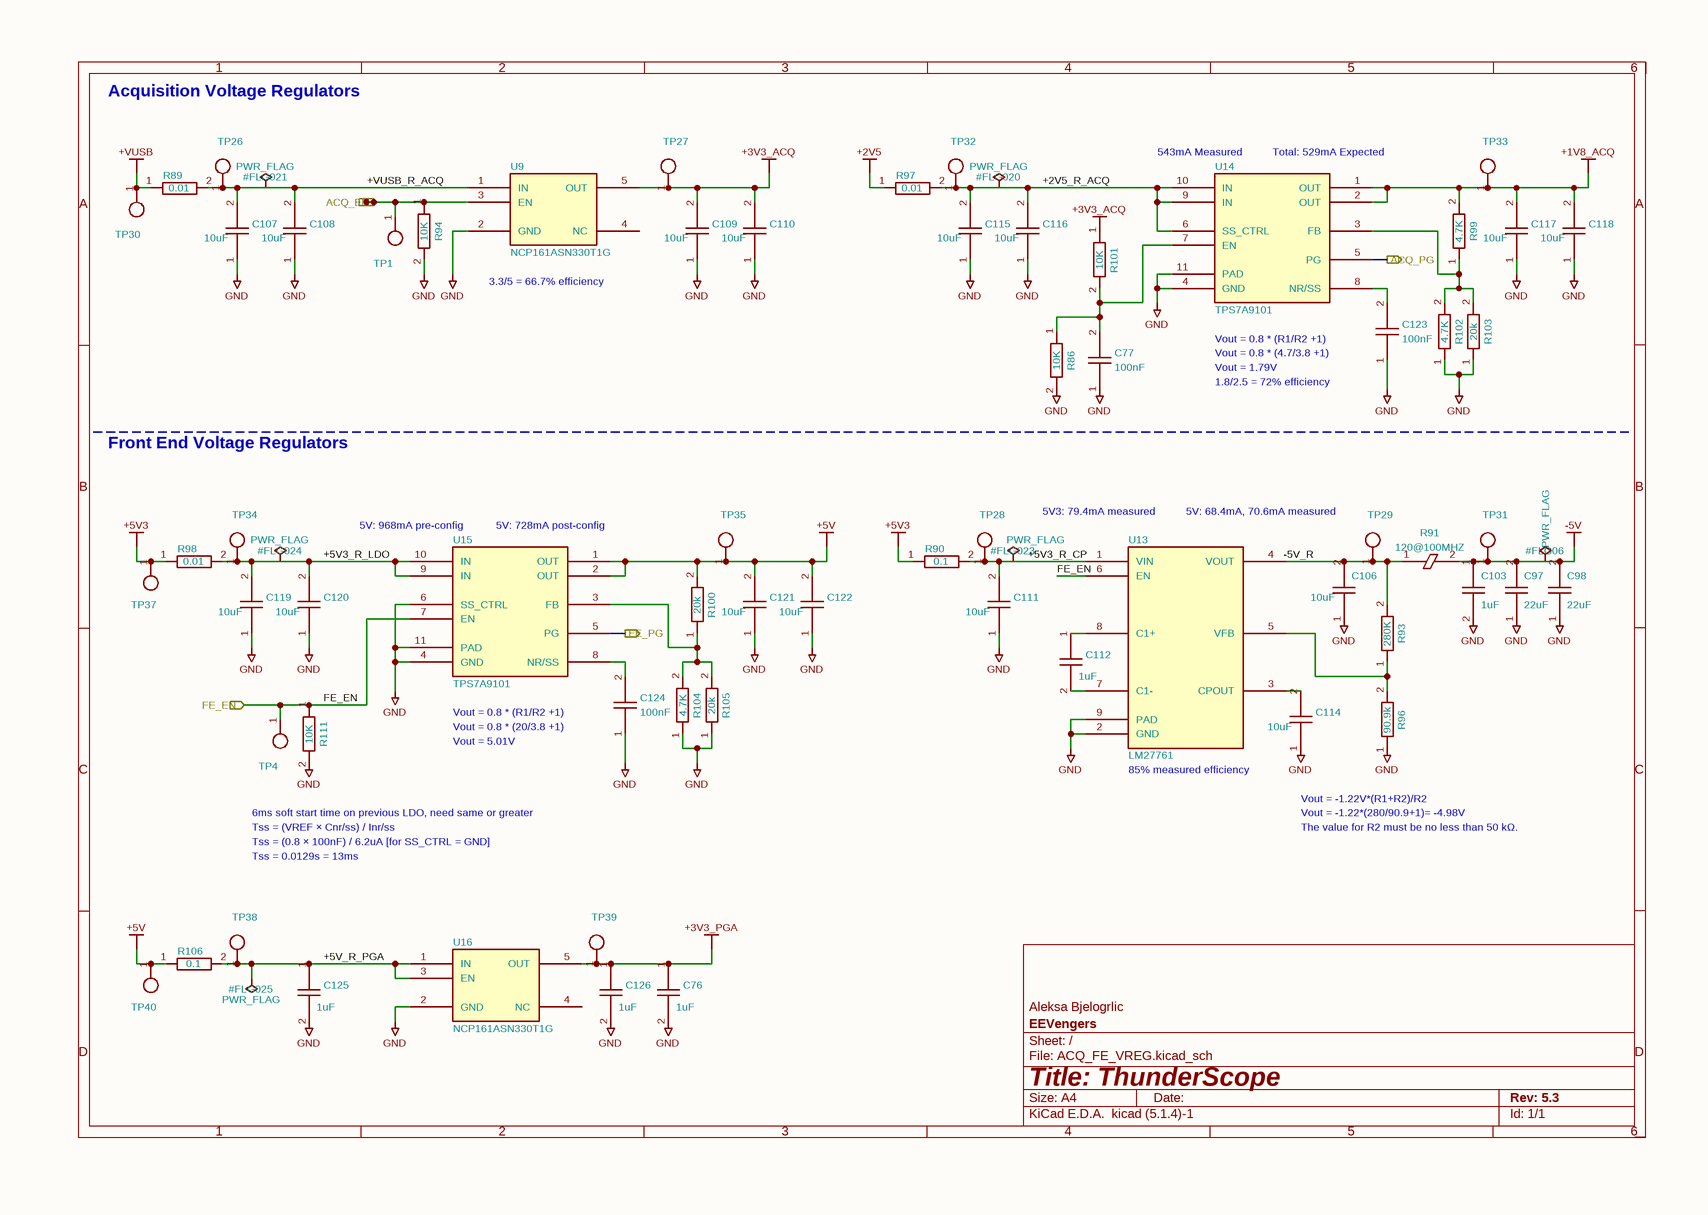
[diagram p14: ACQ_FE_VREG.SchDoc]

### Parts
#FLG06  PWR_FLAG  (graphical)
#FLG020  PWR_FLAG  (graphical)
#FLG021  PWR_FLAG  (graphical)
#FLG023  PWR_FLAG  (graphical)
#FLG024  PWR_FLAG  (graphical)
#FLG025  PWR_FLAG  (graphical)
C76  1uF  [GEN_C_0402]
C77  100nF  [GEN_C_0402]
C97  22uF  [GEN_C_0805]
C98  22uF  [GEN_C_0805]
C103  1uF  [GEN_C_0402]
C106  10uF  [GEN_C_0603]
C107  10uF  [GEN_C_0603]
C108  10uF  [GEN_C_0603]
C109  10uF  [GEN_C_0603]
C110  10uF  [GEN_C_0603]
C111  10uF  [GEN_C_0603]
C112  1uF  [GEN_C_0402]
C114  10uF  [GEN_C_0603]
C115  10uF  [GEN_C_0603]
C116  10uF  [GEN_C_0603]
C117  10uF  [GEN_C_0603]
C118  10uF  [GEN_C_0603]
C119  10uF  [GEN_C_0603]
C120  10uF  [GEN_C_0603]
C121  10uF  [GEN_C_0603]
C122  10uF  [GEN_C_0603]
C123  100nF  [GEN_C_0402]
C124  100nF  [GEN_C_0402]
C125  1uF  [GEN_C_0402]
C126  1uF  [GEN_C_0402]
R86  10K  [GEN_R_0402]
R89  0.01  [GEN_R_0603]
R90  0.1  [GEN_R_0402]
R91  120@100MHZ  [GEN_R_0402]
R93  280K  [GEN_R_0402]
R94  10K  [GEN_R_0402]
R96  90.9k  [GEN_R_0402]
R97  0.01  [GEN_R_0603]
R98  0.01  [GEN_R_0603]
R99  4.7K  [GEN_R_0402]
R100  20k  [GEN_R_0402]
R101  10K  [GEN_R_0402]
R102  4.7K  [GEN_R_0402]
R103  20k  [GEN_R_0402]
R104  4.7K  [GEN_R_0402]
R105  20k  [GEN_R_0402]
R106  0.1  [GEN_R_0402]
R111  10K  [GEN_R_0402]
TP1  PCB  [GEN_TP_PCB]  (value not drawn)
TP4  PCB  [GEN_TP_PCB]  (value not drawn)
TP26  PCB  [GEN_TP_PCB]  (value not drawn)
TP27  PCB  [GEN_TP_PCB]  (value not drawn)
TP28  PCB  [GEN_TP_PCB]  (value not drawn)
TP29  PCB  [GEN_TP_PCB]  (value not drawn)
TP30  PCB  [GEN_TP_PCB]  (value not drawn)
TP31  PCB  [GEN_TP_PCB]  (value not drawn)
TP32  PCB  [GEN_TP_PCB]  (value not drawn)
TP33  PCB  [GEN_TP_PCB]  (value not drawn)
TP34  PCB  [GEN_TP_PCB]  (value not drawn)
TP35  PCB  [GEN_TP_PCB]  (value not drawn)
TP37  PCB  [GEN_TP_PCB]  (value not drawn)
TP38  PCB  [GEN_TP_PCB]  (value not drawn)
TP39  PCB  [GEN_TP_PCB]  (value not drawn)
TP40  PCB  [GEN_TP_PCB]  (value not drawn)
U9  NCP161ASN330T1G  [GEN_SOT23_5_950_2900X1600X1450]
U13  LM27761  [TI_WSON8_DSG0008A]
U14  TPS7A9101  [TI_WSON10_DSK0010A]
U15  TPS7A9101  [TI_WSON10_DSK0010A]
U16  NCP161ASN330T1G  [GEN_SOT23_5_950_2900X1600X1450]

### Ports
ACQ_EN (in), ACQ_PG (out), FE_EN (in), FE_PG (out)

### Nets
+1V8_ACQ: C117.2 C118.2 R99.2 TP33.1 U14.1(OUT) U14.2(OUT)
+2V5: R97.1
+3V3_ACQ: C109.2 C110.2 R101.1 TP27.1 U9.5(OUT)
+3V3_PGA: C76.1 C126.1 TP39.1 U16.5(OUT)
+5V: C121.2 C122.2 R100.2 R106.1 TP35.1 TP40.1 U15.1(OUT) U15.2(OUT)
+5V3: R90.1 R98.1 TP37.1
+VUSB: R89.1 TP30.1
-5V: #FLG06.1 C97.2 C98.2 C103.1 R91.2 TP31.1
GND: C76.2 C77.1 C97.1 C98.1 C103.2 C106.1 C107.1 C108.1 C109.1 C110.1 C111.1 C114.1 C115.1 C116.1 C117.1 C118.1 C119.1 C120.1 C121.1 C122.1 C123.1 C124.1 C125.2 C126.2 R86.2 R94.2 R96.1 R102.1 R103.1 R104.1 R105.1 R111.2 U9.2(GND) U13.2(GND) U13.9(PAD) U14.4(GND) U14.11(PAD) U15.4(GND) U15.6(SS_CTRL) U15.11(PAD) U16.2(GND)
+2V5_R_ACQ: #FLG020.1 C115.2 C116.2 R97.2 TP32.1 U14.6(SS_CTRL) U14.9(IN) U14.10(IN)
+5V3_R_CP: #FLG023.1 C111.2 R90.2 TP28.1 U13.1(VIN)
+5V3_R_LDO: #FLG024.1 C119.2 C120.2 R98.2 TP34.1 U15.9(IN) U15.10(IN)
+5V_R_PGA: #FLG025.1 C125.1 R106.2 TP38.1 U16.1(IN) U16.3(EN)
+VUSB_R_ACQ: #FLG021.1 C107.2 C108.2 R89.2 TP26.1 U9.1(IN)
-5V_R: C106.2 R91.1 R93.2 TP29.1 U13.4(VOUT)
ACQ_EN: R94.1 TP1.1 U9.3(EN) ; port ACQ_EN
ACQ_PG: U14.5(PG) ; port ACQ_PG
FE_EN: R111.1 TP4.1 U13.6(EN) U15.7(EN) ; port FE_EN
FE_PG: U15.5(PG) ; port FE_PG
NetC77_2: C77.2 R86.1 R101.2 U14.7(EN)
NetC112_1: C112.1 U13.8(C1+)
NetC112_2: C112.2 U13.7(C1-)
NetC114_2: C114.2 U13.3(CPOUT)
NetC123_2: C123.2 U14.8(NR/SS)
NetC124_2: C124.2 U15.8(NR/SS)
NetR93_1: R93.1 R96.2 U13.5(VFB)
NetR99_1: R99.1 R102.2 R103.2 U14.3(FB)
NetR100_1: R100.1 R104.2 R105.2 U15.3(FB)

Not connected (* = marked no-connect by the designer): U9 4(NC); U16 4(NC)

### Notes on the sheet
- Acquisition Voltage Regulators
- (near U14) 543mA Measured
- (near U14) Total: 529mA Expected
- 3.3/5 = 66.7% efficiency
- Vout = 0.8 * (R1/R2 +1)
- Vout = 0.8 * (4.7/3.8 +1)
- 1.8/2.5 = 72% efficiency
- Vout = 1.79V
- Front End Voltage Regulators
- (near U15) 5V: 968mA pre-config
- (near U15) 5V: 728mA post-config
- 5V3: 79.4mA measured
- 5V: 68.4mA, 70.6mA measured
- Vout = 0.8 * (20/3.8 +1)
- Vout = 5.01V
- (near U13) 85% measured efficiency
- Tss = 0.0129s = 13ms
- Tss = (0.8 × 100nF) / 6.2uA [for SS_CTRL = GND]
- 6ms soft start time on previous LDO, need same or greater
- Tss = (VREF × Cnr/ss) / Inr/ss
- Vout = -1.22V*(R1+R2)/R2
- Vout = -1.22*(280/90.9+1)= -4.98V
- The value for R2 must be no less than 50 kΩ.
- 1
- 2
- 3
- 4
- 5
- 6
- A
- B
- C
- Aleksa Bjelogrlic
- D
- Title: ThunderScope
- File: ACQ_FE_VREG.kicad_sch
- Sheet: /
- EEVengers
- KiCad E.D.A.  kicad (5.1.4)-1
- Size: A4
- Date:
- Rev: 5.3
- Id: 1/1

### Library data of the parts
C76 C103 C112 C125 C126 = CAP 1uF 25V X5R 0402: as C16 on sheet ADC; PACKAGE: 0402; SUPPLIER 1: Mouser; SUPPLIER PART NUMBER 1: 81-GRM155R61E105KA2D; Footprint: Thunderscope_Rev5:GEN_C_0402; Value: 1uF
C77 C123 C124 = CAP 100nF 16V X7R 0402: as C13 on sheet CON_PCIe_X4; PACKAGE: 0402; SUPPLIER 1: Mouser; SUPPLIER PART NUMBER 1: 81-GCM155R71C104KA5D; Footprint: Thunderscope_Rev5:GEN_C_0402; Value: 100nF
C97 C98 = CAP 22uF 25V X5R 0805: as C12 on sheet CON_PCIe_X4; PACKAGE: 0805; SUPPLIER 1: Mouser; SUPPLIER PART NUMBER 1: 81-GRM21BR61E226ME4L; Footprint: Thunderscope_Rev5:GEN_C_0805; Value: 22uF
C106-C111 C114-C122 = CAP 10uF 25V X5R 0603: as C14 on sheet ADC; PACKAGE: 0402; SUPPLIER 1: Mouser; SUPPLIER PART NUMBER 1: 81-GRM188R61E106MA3D; Footprint: Thunderscope_Rev5:GEN_C_0603; Value: 10uF
R86 R94 R101 R111 = RES 10K OHM 1% 1/16W 0402: as R81 on sheet CON_PCIe_X4; PACKAGE: 0402; SUPPLIER 1: Mouser; SUPPLIER PART NUMBER 1: 603-RC0402FR-0710KL; Footprint: Thunderscope_Rev5:GEN_R_0402; Value: 10K
R89 R97 R98 = RES 0.01 OHM 1% 1/4W 0603: as R42 on sheet CON_PCIe_X4; SUPPLIER 1: Mouser; SUPPLIER PART NUMBER 1: 754-RL0816T-R010-F; PACKAGE: 0603; Footprint: Thunderscope_Rev5:GEN_R_0603; Value: 0.01
R90 R106 = RES 0.1 OHM 1% 1/6W 0402: MANUFACTURER: Panasonic; MANUFACTURER PART NUMBER: ERJ-2BSFR10X; TOLERANCE: 1%; Substitutions Policy: Any Parametric Equivalent; PACKAGE: 0402; SUPPLIER 1: Mouser; SUPPLIER PART NUMBER 1: 667-ERJ-2BSFR10X; Footprint: Thunderscope_Rev5:GEN_R_0402; Value: 0.1
R91 = FERRITE BEAD 120 OHM 0402: as FB1 on sheet ADC; SUPPLIER 1: Mouser; SUPPLIER PART NUMBER 1: 81-BLM15PX121SN1D; MANUFACTURER PART NUMBER: BLM15PX121SN1D; PACKAGE: 0402; Footprint: Thunderscope_Rev5:GEN_R_0402; Value: 120@100MHZ
R93 = RES 280K OHM 1% 1/16W 0402: MANUFACTURER: Yageo; MANUFACTURER PART NUMBER: RC0402FR-07280KL; TOLERANCE: 1%; Substitutions Policy: Any Parametric Equivalent; PACKAGE: 0402; SUPPLIER 1: Mouser; SUPPLIER PART NUMBER 1: 603-RC0402FR-07280KL; Footprint: Thunderscope_Rev5:GEN_R_0402; Value: 280K
R96 = RES 90.9K OHM 1% 1/16W 0402: MANUFACTURER: Yageo; MANUFACTURER PART NUMBER: RC0402FR-0790K9L; TOLERANCE: 1%; Substitutions Policy: Any Parametric Equivalent; PACKAGE: 0402; SUPPLIER 1: Mouser; SUPPLIER PART NUMBER 1: 603-RC0402FR-0790K9L; Footprint: Thunderscope_Rev5:GEN_R_0402; Value: 90.9k
R99 R102 R104 = RES 4.7K OHM 1% 1/16W 0402: as R73 on sheet CON_PCIe_X4; PACKAGE: 0402; SUPPLIER 1: Mouser; SUPPLIER PART NUMBER 1: 603-RC0402FR-074K7L; Footprint: Thunderscope_Rev5:GEN_R_0402; Value: 4.7K
R100 R103 R105 = RES 20K OHM 1% 1/16W 0402: MANUFACTURER: Yageo; MANUFACTURER PART NUMBER: RC0402FR-0720KL; TOLERANCE: 1%; Substitutions Policy: Any Parametric Equivalent; PACKAGE: 0402; SUPPLIER 1: Mouser; SUPPLIER PART NUMBER 1: 603-RC0402FR-0720KL; Footprint: Thunderscope_Rev5:GEN_R_0402; Value: 20k
TP1 TP4 TP26-TP35 TP37-TP40 = TP PCB 1mm: Footprint: Thunderscope_Rev5:GEN_TP_PCB; Value: PCB
U9 U16 = IC LDO NCP161ASN330T1G: MANUFACTURER: onsemi; Substitutions Policy: No Substitutions; MANUFACTURER PART NUMBER: NCP161ASN330T1G; SUPPLIER 1: Mouser; SUPPLIER PART NUMBER 1: 863-NCP161ASN330T1G; PACKAGE: SOT-23-5; Value: NCP161ASN330T1G; Footprint: Thunderscope_Rev5:GEN_SOT23_5_950_2900X1600X1450
U13 = IC CPUMP LM27761: MANUFACTURER: Texas Instruments; MANUFACTURER PART NUMBER: LM27761DSGR; Substitutions Policy: No Substitutions; SUPPLIER 1: Texas Instruments; SUPPLIER PART NUMBER 1: LM27761DSGR; PACKAGE: 8-WFDFN (2x2mm); Value: LM27761; Footprint: Thunderscope_Rev5:TI_WSON8_DSG0008A
U14 U15 = IC LDO TPS7A9101: MANUFACTURER: Texas Instruments; MANUFACTURER PART NUMBER: TPS7A9101DSKR; Substitutions Policy: No Substitutions; SUPPLIER 1: Texas Instruments; SUPPLIER PART NUMBER 1: TPS7A9101DSKR; PACKAGE: 10-DFN (2.5x2.5mm); Value: TPS7A9101; Footprint: Thunderscope_Rev5:TI_WSON10_DSK0010A
#FLG06 #FLG020 #FLG021 #FLG023 #FLG024 #FLG025 = PWR_FLAG: Value: PWR_FLAG

## Nets that join several sheets
+1V0: FPGA_PWR (32 pins), FPGA_VREG (#FLG012.1 R116.2 TP66.1)
+1V2_MGT: FPGA_PWR (10 pins), FPGA_VREG (6 pins), FPGA_CFG_MGT (R115.1)
+1V8: FPGA_PWR (13 pins), FPGA_VREG (#FLG013.1 R120.2 R123.1 TP64.1)
+1V8_ACQ: PLL (C92.1 FB3.2), ADC (FB1.2 FB2.1), ACQ_FE_VREG (6 pins)
+2V5: FPGA_PWR (14 pins), FPGA_VREG (#FLG014.1 R126.2 TP68.1), ACQ_FE_VREG (R97.1)
+3V3: FPGA (8 pins), FPGA_PWR (18 pins), FPGA_Bank_IO (6 pins), FPGA_VREG (#FLG015.1 R57.2 TP70.1), FPGA_CFG_MGT (9 pins), M2_KEY_M (R82.1)
+3V3_ACQ: PLL (28 pins), ADC Driver 1 (8 pins), ADC Driver 2 (8 pins), ADC (5 pins), ADC Driver 3 (8 pins), ADC Driver 4 (8 pins), ACQ_FE_VREG (5 pins)
+3V3_PGA: CH3 (C1043_4_CH3.1 R1033_4_CH3.1 U1008_4_CH3.12), FPGA (C1.1 U1.5), FE (Q1.2 Q2.2 R9.2 R10.2), CH4 (C1043_4_CH4.1 R1033_4_CH4.1 U1008_4_CH4.12), CH2 (C1043_4_CH2.1 R1033_4_CH2.1 U1008_4_CH2.12), ACQ_FE_VREG (C76.1 C126.1 TP39.1 U16.5), CH1 (C1043_4_CH1.1 R1033_4_CH1.1 U1008_4_CH1.12)
+5V: CH3 (17 pins), FE (15 pins), CH4 (17 pins), CH2 (17 pins), ACQ_FE_VREG (8 pins), CH1 (17 pins)
+5V3: M2_KEY_M (6 pins), CON_PCIe_X4 (R71.2 TP72.1), ACQ_FE_VREG (R90.1 R98.1 TP37.1)
+VBIAS: CH3 (C1033_4_CH3.2 R1045_4_CH3.1 R1046_4_CH3.1), FE (C6.1 R13.2 TP8.1 U4.5), CH4 (C1033_4_CH4.2 R1045_4_CH4.1 R1046_4_CH4.1), CH2 (C1033_4_CH2.2 R1045_4_CH2.1 R1046_4_CH2.1), CH1 (C1033_4_CH1.2 R1045_4_CH1.1 R1046_4_CH1.1)
+VUSB: CH3 (C1026_4_CH3.2 C1028_4_CH3.2 R1027_4_CH3.1 R1028_4_CH3.1), FPGA_VREG (16 pins), M2_KEY_M (5 pins), CON_PCIe_X4 (9 pins), CH4 (C1026_4_CH4.2 C1028_4_CH4.2 R1027_4_CH4.1 R1028_4_CH4.1), CH2 (C1026_4_CH2.2 C1028_4_CH2.2 R1027_4_CH2.1 R1028_4_CH2.1), ACQ_FE_VREG (R89.1 TP30.1), CH1 (C1026_4_CH1.2 C1028_4_CH1.2 R1027_4_CH1.1 R1028_4_CH1.1)
-5V: CH3 (16 pins), FE (C11.2 C93.1 U5.2), CH4 (16 pins), CH2 (16 pins), ACQ_FE_VREG (6 pins), CH1 (16 pins)
-VBIAS: CH3 (C1032_4_CH3.2 R1042_4_CH3.1), FE (#FLG01.1 C82.2 R107.1 TP9.1), CH4 (C1032_4_CH4.2 R1042_4_CH4.1), CH2 (C1032_4_CH2.2 R1042_4_CH2.1), CH1 (C1032_4_CH1.2 R1042_4_CH1.1)
AGND: FPGA_PWR (#FLG011.1 C167.2 U18.J9), FPGA_CFG_MGT (5 pins)
GND: Thunderscope_Rev5.3 (7 pins), CH3 (63 pins), FPGA (25 pins), FPGA_PWR (121 pins), FPGA_Bank_IO (R76.1 R78.1 R80.1), FPGA_VREG (30 pins), FPGA_CFG_MGT (8 pins), M2_KEY_M (34 pins), PLL (29 pins), ADC Driver 1 (9 pins), ADC Driver 2 (9 pins), CON_PCIe_X4 (47 pins), ADC (21 pins), FE (20 pins), ADC Driver 3 (9 pins), CH4 (63 pins), CH2 (63 pins), ADC Driver 4 (9 pins), ACQ_FE_VREG (41 pins), CH1 (63 pins)
ACQ_EN: FPGA_Bank_IO (U18.T17), ACQ_FE_VREG (R94.1 TP1.1 U9.3)
ACQ_PG: FPGA_Bank_IO (R59.2 TP24.1 U18.V17), ACQ_FE_VREG (U14.5)
ADC_CLK_N: PLL (U7.48), ADC (R22.1 U6.34)
ADC_CLK_P: PLL (U7.47), ADC (R22.2 U6.35)
ADC_CSn: FPGA_Bank_IO (U18.U17), ADC (R15.2 TP10.1 U6.2)
ADC_SCLK: FPGA_Bank_IO (U18.U16), ADC (TP12.1 U6.4)
ADC_SDATA: FPGA_Bank_IO (U18.R16), ADC (TP11.1 U6.3)
ATTEN_1: FPGA_Bank_IO (U18.N17), CH1 (R1030_4_CH1.2 R1032_4_CH1.1 TP1015_4_CH1.1)
ATTEN_2: FPGA_Bank_IO (U18.M16), CH2 (R1030_4_CH2.2 R1032_4_CH2.1 TP1015_4_CH2.1)
ATTEN_3: CH3 (R1030_4_CH3.2 R1032_4_CH3.1 TP1015_4_CH3.1), FPGA_Bank_IO (U18.L18)
ATTEN_4: FPGA_Bank_IO (U18.V11), CH4 (R1030_4_CH4.2 R1032_4_CH4.1 TP1015_4_CH4.1)
CH1_N: ADC Driver 1 (R131_4_ADC_Driver_1.1 R133_4_ADC_Driver_1.1), CH1 (R97_4_CH1.2)
CH1_P: ADC Driver 1 (R131_4_ADC_Driver_1.2 R132_4_ADC_Driver_1.1), CH1 (R52_4_CH1.2)
CH2_N: ADC Driver 2 (R131_4_ADC_Driver_2.1 R133_4_ADC_Driver_2.1), CH2 (R97_4_CH2.2)
CH2_P: ADC Driver 2 (R131_4_ADC_Driver_2.2 R132_4_ADC_Driver_2.1), CH2 (R52_4_CH2.2)
CH3_N: CH3 (R97_4_CH3.2), ADC Driver 3 (R131_4_ADC_Driver_3.1 R133_4_ADC_Driver_3.1)
CH3_P: CH3 (R52_4_CH3.2), ADC Driver 3 (R131_4_ADC_Driver_3.2 R132_4_ADC_Driver_3.1)
CH4_N: CH4 (R97_4_CH4.2), ADC Driver 4 (R131_4_ADC_Driver_4.1 R133_4_ADC_Driver_4.1)
CH4_P: CH4 (R52_4_CH4.2), ADC Driver 4 (R131_4_ADC_Driver_4.2 R132_4_ADC_Driver_4.1)
CLK25: FPGA (Y2.3), FPGA_Bank_IO (U18.T14)
COMP: FPGA (TP61.1 U1.4), CON_PCIe_X4 (R7.2)
D1A_N: FPGA_Bank_IO (U18.A9), ADC (U6.10)
D1A_P: FPGA_Bank_IO (U18.B9), ADC (U6.9)
D1B_N: FPGA_Bank_IO (U18.A10), ADC (U6.12)
D1B_P: FPGA_Bank_IO (U18.B10), ADC (U6.11)
D2A_N: FPGA_Bank_IO (U18.C12), ADC (U6.14)
D2A_P: FPGA_Bank_IO (U18.D11), ADC (U6.13)
D2B_N: FPGA_Bank_IO (U18.C11), ADC (U6.16)
D2B_P: FPGA_Bank_IO (U18.B11), ADC (U6.15)
D3A_N: FPGA_Bank_IO (U18.A14), ADC (U6.22)
D3A_P: FPGA_Bank_IO (U18.A13), ADC (U6.21)
D3B_N: FPGA_Bank_IO (U18.A15), ADC (U6.24)
D3B_P: FPGA_Bank_IO (U18.B14), ADC (U6.23)
D4A_N: FPGA_Bank_IO (U18.C13), ADC (U6.26)
D4A_P: FPGA_Bank_IO (U18.D13), ADC (U6.25)
D4B_N: FPGA_Bank_IO (U18.B15), ADC (U6.28)
D4B_P: FPGA_Bank_IO (U18.C14), ADC (U6.27)
DC_CPL_1: FPGA_Bank_IO (U18.N16), CH1 (5 pins)
DC_CPL_2: FPGA_Bank_IO (U18.M15), CH2 (5 pins)
DC_CPL_3: CH3 (5 pins), FPGA_Bank_IO (U18.N18)
DC_CPL_4: FPGA_Bank_IO (U18.V12), CH4 (5 pins)
FCLK_N: FPGA_Bank_IO (U18.B12), ADC (U6.20)
FCLK_P: FPGA_Bank_IO (U18.A12), ADC (U6.19)
FE_EN: FPGA_Bank_IO (U18.U15), ACQ_FE_VREG (R111.1 TP4.1 U13.6 U15.7)
FE_PG: FPGA_Bank_IO (R58.2 TP23.1 U18.V16), ACQ_FE_VREG (U15.5)
IN1_N: ADC (R18.1 U6.47), ADC Driver 4 (R137_4_ADC_Driver_4.2)
IN1_P: ADC (R18.2 U6.46), ADC Driver 4 (R136_4_ADC_Driver_4.2)
IN2_N: ADC (R19.1 U6.44), ADC Driver 3 (R137_4_ADC_Driver_3.2)
IN2_P: ADC (R19.2 U6.43), ADC Driver 3 (R136_4_ADC_Driver_3.2)
IN3_N: ADC Driver 2 (R137_4_ADC_Driver_2.2), ADC (R20.1 U6.41)
IN3_P: ADC Driver 2 (R136_4_ADC_Driver_2.2), ADC (R20.2 U6.40)
IN4_N: ADC Driver 1 (R137_4_ADC_Driver_1.2), ADC (R21.1 U6.38)
IN4_P: ADC Driver 1 (R136_4_ADC_Driver_1.2), ADC (R21.2 U6.37)
LCLK_N: FPGA_Bank_IO (U18.D14), ADC (U6.18)
LCLK_P: FPGA_Bank_IO (U18.E13), ADC (U6.17)
LED_B: FPGA (R65.2 R85.2 TP58.1), FPGA_Bank_IO (U18.U14)
LED_G: FPGA (R6.1 TP57.1), FPGA_Bank_IO (U18.R13)
LED_R: FPGA (R64.1 TP56.1), FPGA_Bank_IO (U18.T15)
MGT_CLK1_N: FPGA_CFG_MGT (U18.B5), M2_KEY_M (C46.2), CON_PCIe_X4 (C44.2)
MGT_CLK1_P: FPGA_CFG_MGT (U18.B6), M2_KEY_M (C47.2), CON_PCIe_X4 (C45.2)
MGT_RX0_N: FPGA_CFG_MGT (U18.E3), M2_KEY_M (R27.1), CON_PCIe_X4 (R25.1)
MGT_RX0_P: FPGA_CFG_MGT (U18.E4), M2_KEY_M (R28.1), CON_PCIe_X4 (R26.1)
MGT_RX1_N: FPGA_CFG_MGT (U18.A3), M2_KEY_M (R31.1), CON_PCIe_X4 (R29.1)
MGT_RX1_P: FPGA_CFG_MGT (U18.A4), M2_KEY_M (R32.1), CON_PCIe_X4 (R30.1)
MGT_RX2_N: FPGA_CFG_MGT (U18.C3), M2_KEY_M (R35.1), CON_PCIe_X4 (R33.1)
MGT_RX2_P: FPGA_CFG_MGT (U18.C4), M2_KEY_M (R36.1), CON_PCIe_X4 (R34.1)
MGT_RX3_N: FPGA_CFG_MGT (U18.G3), M2_KEY_M (R39.1), CON_PCIe_X4 (R37.1)
MGT_RX3_P: FPGA_CFG_MGT (U18.G4), M2_KEY_M (R40.1), CON_PCIe_X4 (R38.1)
MGT_TX0_N: FPGA_CFG_MGT (U18.H1), M2_KEY_M (C30.2), CON_PCIe_X4 (C28.2)
MGT_TX0_P: FPGA_CFG_MGT (U18.H2), M2_KEY_M (C31.2), CON_PCIe_X4 (C29.2)
MGT_TX1_N: FPGA_CFG_MGT (U18.F1), M2_KEY_M (C34.2), CON_PCIe_X4 (C32.2)
MGT_TX1_P: FPGA_CFG_MGT (U18.F2), M2_KEY_M (C35.2), CON_PCIe_X4 (C33.2)
MGT_TX2_N: FPGA_CFG_MGT (U18.D1), M2_KEY_M (C38.2), CON_PCIe_X4 (C36.2)
MGT_TX2_P: FPGA_CFG_MGT (U18.D2), M2_KEY_M (C39.2), CON_PCIe_X4 (C37.2)
MGT_TX3_N: FPGA_CFG_MGT (U18.B1), M2_KEY_M (C42.2), CON_PCIe_X4 (C40.2)
MGT_TX3_P: FPGA_CFG_MGT (U18.B2), M2_KEY_M (C43.2), CON_PCIe_X4 (C41.2)
PERST#: FPGA (TP13.1), FPGA_Bank_IO (U18.U9), M2_KEY_M (R24.1), CON_PCIe_X4 (R23.1)
PGA_CSn_1: FPGA_Bank_IO (U18.P16), CH1 (R1033_4_CH1.2 TP1016_4_CH1.1 U1008_4_CH1.9)
PGA_CSn_2: FPGA_Bank_IO (U18.M17), CH2 (R1033_4_CH2.2 TP1016_4_CH2.1 U1008_4_CH2.9)
PGA_CSn_3: CH3 (R1033_4_CH3.2 TP1016_4_CH3.1 U1008_4_CH3.9), FPGA_Bank_IO (U18.R17)
PGA_CSn_4: FPGA_Bank_IO (U18.U11), CH4 (R1033_4_CH4.2 TP1016_4_CH4.1 U1008_4_CH4.9)
PGA_SCLK: CH3 (U1008_4_CH3.11), FPGA_Bank_IO (TP25.1 U18.N14), CH4 (U1008_4_CH4.11), CH2 (U1008_4_CH2.11), CH1 (U1008_4_CH1.11)
PGA_SDIO: CH3 (U1008_4_CH3.10), FPGA_Bank_IO (TP42.1 U18.P15), CH4 (U1008_4_CH4.10), CH2 (U1008_4_CH2.10), CH1 (U1008_4_CH1.10)
PLL_RSTn: FPGA_Bank_IO (U18.P14), PLL (R44.1 R45.2 TP18.1)
PLL_SCL: FPGA_Bank_IO (U18.U12), PLL (R46.1 TP17.1 U7.24)
PLL_SDA: FPGA_Bank_IO (U18.T12), PLL (R47.1 TP16.1 U7.25)
PROBE_COMP: FPGA (R8.1 U1.2), FPGA_Bank_IO (U18.R15)
QSPI_CS: FPGA_Bank_IO (U18.L15), FPGA_CFG_MGT (R67.1 TP53.1 U19.1)
REFINOUT: M2_KEY_M (R4.1), PLL (C64.1 R43.2), CON_PCIe_X4 (R5.1)
SYNC: FPGA (R63.1 U10.2), M2_KEY_M (R2.1), CON_PCIe_X4 (R3.1)
SYNC_DE: FPGA (R62.1 TP54.1 U10.1), FPGA_Bank_IO (U18.V9)
SYNC_IN_N: FPGA (U10.11), FPGA_Bank_IO (U18.C8)
SYNC_IN_P: FPGA (U10.12), FPGA_Bank_IO (U18.D8)
SYNC_OUT_N: FPGA (R60.1 U10.9), FPGA_Bank_IO (U18.C9)
SYNC_OUT_P: FPGA (R60.2 U10.10), FPGA_Bank_IO (U18.D9)
SYNC_REn: FPGA (R61.2 TP55.1 U10.8), FPGA_Bank_IO (U18.U10)
TCK: FPGA (J5.4), FPGA_CFG_MGT (TP77.1 U18.F8)
TDI: FPGA (J5.2), FPGA_CFG_MGT (TP75.1 U18.T9)
TDO: FPGA (J5.3), FPGA_CFG_MGT (TP76.1 U18.T8)
TERM_1: FPGA_Bank_IO (U18.M14), CH1 (R1029_4_CH1.2 R1031_4_CH1.1 TP1014_4_CH1.1)
TERM_2: FPGA_Bank_IO (U18.K15), CH2 (R1029_4_CH2.2 R1031_4_CH2.1 TP1014_4_CH2.1)
TERM_3: CH3 (R1029_4_CH3.2 R1031_4_CH3.1 TP1014_4_CH3.1), FPGA_Bank_IO (U18.K17)
TERM_4: FPGA_Bank_IO (U18.V13), CH4 (R1029_4_CH4.2 R1031_4_CH4.1 TP1014_4_CH4.1)
TMS: FPGA (J5.1), FPGA_CFG_MGT (TP78.1 U18.R8)
TRIM_1: FE (U2.14), CH1 (C1041_4_CH1.2 FB1001_4_CH1.1)
TRIM_2: FE (U2.9), CH2 (C1041_4_CH2.2 FB1001_4_CH2.1)
TRIM_3: CH3 (C1041_4_CH3.2 FB1001_4_CH3.1), FE (U2.8)
TRIM_4: FE (U2.1), CH4 (C1041_4_CH4.2 FB1001_4_CH4.1)
TRIM_SCL: FPGA_Bank_IO (U18.T13), FE (Q1.3 R9.1 TP59.1)
TRIM_SDA: FPGA_Bank_IO (U18.V14), FE (Q2.3 R10.1 TP60.1)
USERIO.USRIO_1_N: FPGA (J9.8), FPGA_Bank_IO (U18.F17)
USERIO.USRIO_1_P: FPGA (J9.9), FPGA_Bank_IO (U18.E18)
USERIO.USRIO_2_N: FPGA (J9.5), FPGA_Bank_IO (U18.G17)
USERIO.USRIO_2_P: FPGA (J9.6), FPGA_Bank_IO (U18.F18)
USERIO.USRIO_3_N: FPGA (J9.2), FPGA_Bank_IO (U18.H18)
USERIO.USRIO_3_P: FPGA (J9.3), FPGA_Bank_IO (U18.H17)
USERIO.USRIO_4_N: FPGA (J9.12), FPGA_Bank_IO (U18.F14)
USERIO.USRIO_4_P: FPGA (J9.11), FPGA_Bank_IO (U18.G14)
USERIO.USRIO_5_N: FPGA (J9.15), FPGA_Bank_IO (U18.H16)
USERIO.USRIO_5_P: FPGA (J9.14), FPGA_Bank_IO (U18.G16)
USERIO.USRIO_6_N: FPGA (J9.18), FPGA_Bank_IO (U18.F15)
USERIO.USRIO_6_P: FPGA (J9.17), FPGA_Bank_IO (U18.G15)
USERIO.USRIO_7_N: FPGA (J9.21), FPGA_Bank_IO (U18.D15)
USERIO.USRIO_7_P: FPGA (J9.20), FPGA_Bank_IO (U18.E15)
USERIO.USRIO_8_N: FPGA (J9.24), FPGA_Bank_IO (U18.D16)
USERIO.USRIO_8_P: FPGA (J9.23), FPGA_Bank_IO (U18.E16)
USERIO.USRIO_9_N: FPGA (J9.27), FPGA_Bank_IO (U18.B17)
USERIO.USRIO_9_P: FPGA (J9.26), FPGA_Bank_IO (U18.C16)
USERIO.USRIO_10_N: FPGA (J9.35), FPGA_Bank_IO (U18.B16)
USERIO.USRIO_10_P: FPGA (J9.36), FPGA_Bank_IO (U18.A17)
USERIO.USRIO_11_N: FPGA (J9.32), FPGA_Bank_IO (U18.C18)
USERIO.USRIO_11_P: FPGA (J9.33), FPGA_Bank_IO (U18.C17)
USERIO.USRIO_12_N: FPGA (J9.29), FPGA_Bank_IO (U18.E17)
USERIO.USRIO_12_P: FPGA (J9.30), FPGA_Bank_IO (U18.D18)
VARIANT: FPGA_Bank_IO (U18.K18), M2_KEY_M (R82.2), CON_PCIe_X4 (R81.2)
VCM: CH3 (U1008_4_CH3.13), ADC Driver 1 (C104_4_ADC_Driver_1.1 U12_4_ADC_Driver_1.9), ADC Driver 2 (C104_4_ADC_Driver_2.1 U12_4_ADC_Driver_2.9), ADC (C27.2 TP5.1 U6.48), ADC Driver 3 (C104_4_ADC_Driver_3.1 U12_4_ADC_Driver_3.9), CH4 (U1008_4_CH4.13), CH2 (U1008_4_CH2.13), ADC Driver 4 (C104_4_ADC_Driver_4.1 U12_4_ADC_Driver_4.9), CH1 (U1008_4_CH1.13)